# Altium project Servo-Board-v1.0.PrjPcb (part 5 of 23)

## Sheet Sec_Controller_Sheet3.SchDoc
size 420 x 297 mm; SheetNumber: 18; SheetTotal: 26
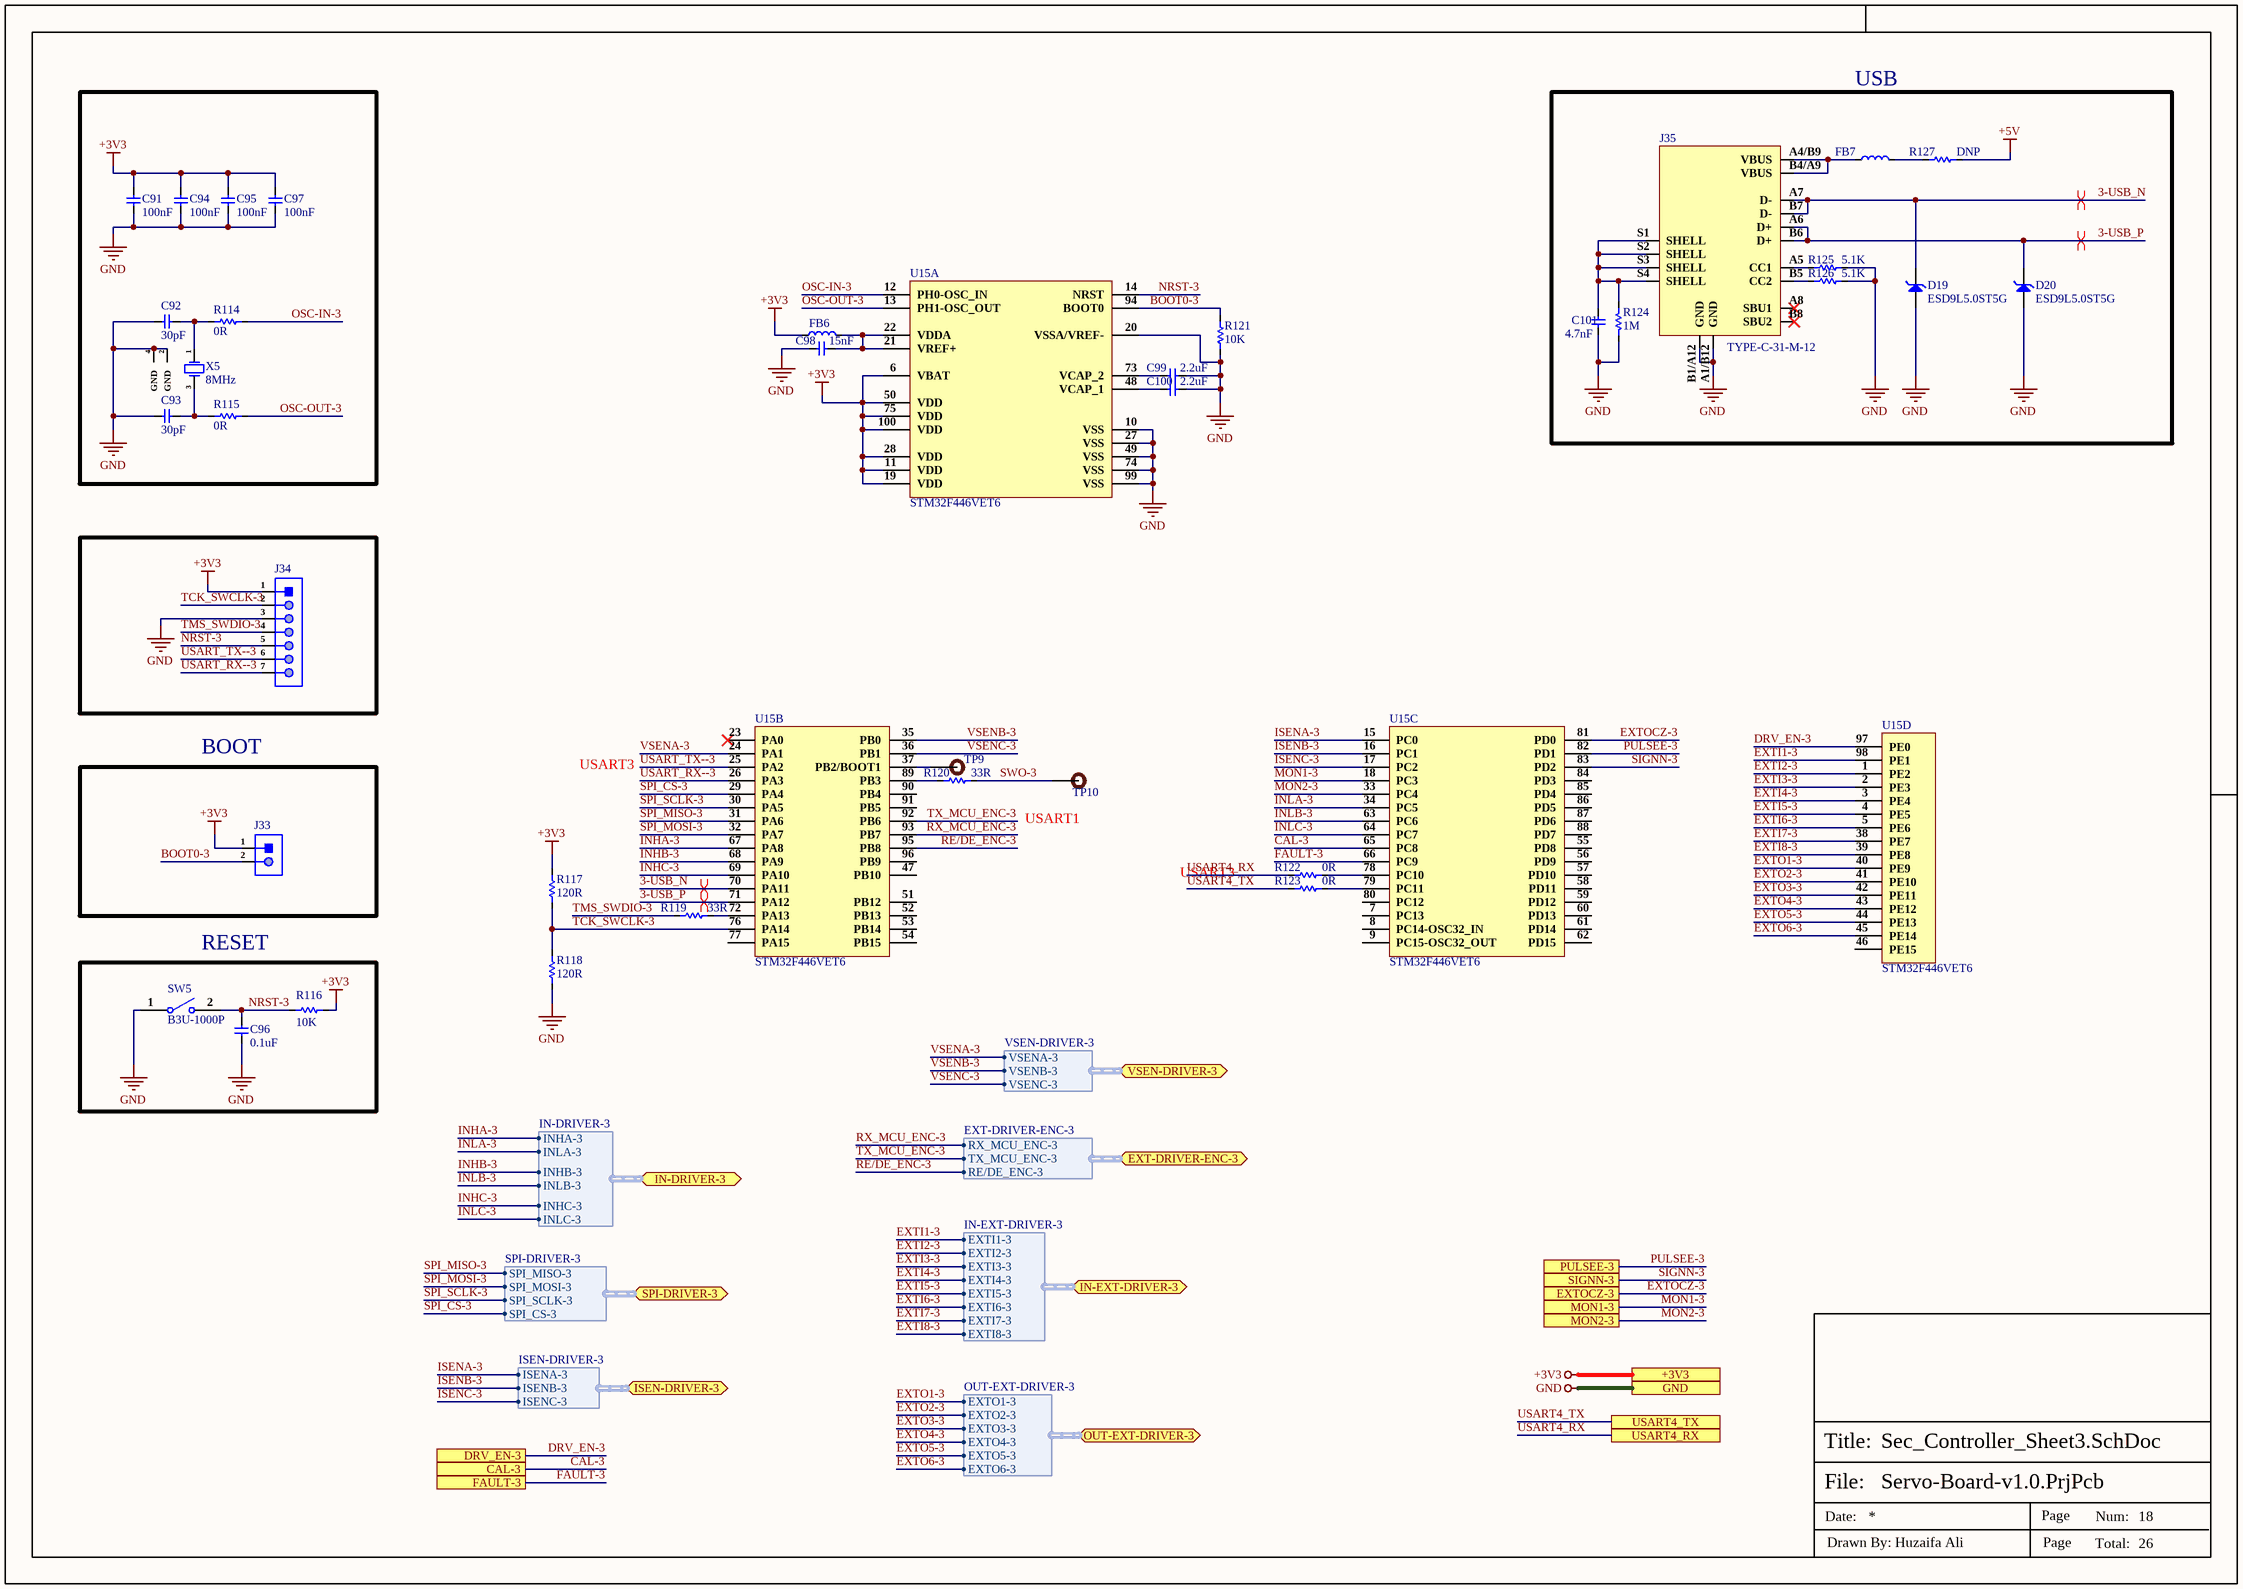
[diagram p6: Sec_Controller_Sheet3.SchDoc]

### Parts
C91  100nF  [cap-0402]
C92  30pF  [Cap-0402]
C93  30pF  [Cap-0402]
C94  100nF  [cap-0402]
C95  100nF  [cap-0402]
C96  0.1uF  [Cap-0402]
C97  100nF  [cap-0402]
C98  15nF  [Cap-0402]
C99  2.2uF  [Cap-0402]
C100  2.2uF  [Cap-0402]
C101  4.7nF  [Cap-0603]
D19  ESD9L5.0ST5G  [SOD-923.]
D20  ESD9L5.0ST5G  [SOD-923.]
FB6  BLM18PG221SN1D  [IND-0603 (1608 Metric)]  (value not drawn)
FB7  BLM18PG221SN1D  [IND-0603 (1608 Metric)]  (value not drawn)
J33  X6511WV-02H-C60D30  [HDR1X2_]  (value not drawn)
J34  X6511WV-07H-C60D30  [HDR1X7]  (value not drawn)
J35  TYPE-C-31-M-12  [TYPE-C-31-M-12_]
R114  0R  [Res-0603]
R115  0R  [Res-0603]
R116  10K  [Res-0402]
R117  120R  [Res-0402]
R118  120R  [Res-0402]
R119  33R  [Res-0402]
R120  33R  [Res-0402]
R121  10K  [Res-0402]
R122  0R  [Res-0402]
R123  0R  [Res-0402]
R124  1M  [Res-0402]
R125  5.1K  [Res-0402]
R126  5.1K  [Res-0402]
R127  DNP  [Res-0402]
SW5  B3U-1000P  [B3U-1000P]
TP9  TEST POINT 0.5mm Dia  [Test-point - 0.5mm]  (value not drawn)  (no BOM)
TP10  TEST POINT 0.5mm Dia  [Test-point - 0.5mm]  (value not drawn)  (no BOM)
U15  STM32F446VET6  [LQFP-100]  (parts A,B,C,D of 4)
X5  8MHz  [5TJ480000XYLBC_]

### Blocks framed on the sheet
USB: C101 D19 D20 FB7 J35 R124-R127
BOOT: J33
RESET: C96 R116 SW5

### Ports
+3V3 (see Servo3[3A], CAN_Sheet[4D], Controller_Sheet[5D], DIO_1[5D], DIO_2[5D], DIO_3[5D], DIO_4[5D], Encoder_Sheet1[5D], Encoder_Sheet2[4D], Encoder_Sheet3[4D], Encoder_Sheet4[5D], EtherCAT_Sheet[5D], Motor_Driver_Sheet1[5D], Motor_Driver_Sheet2[5D], Motor_Driver_Sheet3[5D], Motor_Driver_Sheet4[5D], Power_Sheet[5D], RS485_RS232_Sheet[5D], Sec_Controller_Sheet1[5D], Sec_Controller_Sheet2[5D], Sec_Controller_Sheet4[5D], Servo1[5D], Servo2[5D], Servo3[5D], Servo4[5D]), CAL-3 (see Servo3[3B], Motor_Driver_Sheet3[1D]), DRV_EN-3 (see Servo3[3B], Motor_Driver_Sheet3[1D]), EXT-DRIVER-ENC-3 (bidir, harness EXT-DRIVER-ENC-3, see Servo3[4B], Encoder_Sheet3[3D]), EXTOCZ-3 (see Servo3[4B], DIO_3[3D]), FAULT-3 (see Servo3[3B], Motor_Driver_Sheet3[1D]), GND (see Servo3[3A], CAN_Sheet[4D], Controller_Sheet[5D], DIO_1[5D], DIO_2[5D], DIO_3[5D], DIO_4[5D], Encoder_Sheet1[5D], Encoder_Sheet2[4D], Encoder_Sheet3[4D], Encoder_Sheet4[5D], EtherCAT_Sheet[5D], Motor_Driver_Sheet1[5D], Motor_Driver_Sheet2[5D], Motor_Driver_Sheet3[5D], Motor_Driver_Sheet4[5D], Power_Sheet[5D], RS485_RS232_Sheet[5D], Sec_Controller_Sheet1[5D], Sec_Controller_Sheet2[5D], Sec_Controller_Sheet4[5D], Servo1[5D], Servo2[5D], Servo3[5D], Servo4[5D]), IN-DRIVER-3 (bidir, harness IN-DRIVER-3, see Servo3[3B], Motor_Driver_Sheet3[1D]), IN-EXT-DRIVER-3 (bidir, harness IN-EXT-DRIVER-3, see Servo3[4B], DIO_3[1D]), ISEN-DRIVER-3 (bidir, harness ISEN-DRIVER-3, see Servo3[3B], Motor_Driver_Sheet3[3D]), MON1-3 (see Servo3[4B], DIO_3[3D]), MON2-3 (see Servo3[4B], DIO_3[3D]), OUT-EXT-DRIVER-3 (bidir, harness OUT-EXT-DRIVER-3, see Servo3[4B], DIO_3[2D]), PULSEE-3 (see Servo3[4B], DIO_3[3D]), SIGNN-3 (see Servo3[4B], DIO_3[3D]), SPI-DRIVER-3 (bidir, harness SPI-DRIVER-3, see Servo3[3B], Motor_Driver_Sheet3[2D]), USART4_RX (see Servo3[3B], Controller_Sheet[4D], Servo3[3B]), USART4_TX (see Servo3[3B], Controller_Sheet[4D], Servo3[3B]), VSEN-DRIVER-3 (bidir, harness VSEN-DRIVER-3, see Servo3[3B], Motor_Driver_Sheet3[4D])

### Harnesses
IN-DRIVER-3: INHA-3, INLA-3, INHB-3, INLB-3, INHC-3, INLC-3
SPI-DRIVER-3: SPI_MISO-3, SPI_MOSI-3, SPI_SCLK-3, SPI_CS-3
ISEN-DRIVER-3: ISENA-3, ISENB-3, ISENC-3
EXT-DRIVER-ENC-3: RX_MCU_ENC-3, TX_MCU_ENC-3, RE/DE_ENC-3
IN-EXT-DRIVER-3: EXTI1-3, EXTI2-3, EXTI3-3, EXTI4-3, EXTI5-3, EXTI6-3, EXTI7-3, EXTI8-3
OUT-EXT-DRIVER-3: EXTO1-3, EXTO2-3, EXTO3-3, EXTO4-3, EXTO5-3, EXTO6-3
VSEN-DRIVER-3: VSENA-3, VSENB-3, VSENC-3

### Nets
+3V3: C91.2 C94.2 C95.2 C97.2 FB6.1 J33.1 J34.1 R116.2 R117.2 U15.6(VBAT) U15.11(VDD) U15.19(VDD) U15.28(VDD) U15.50(VDD) U15.75(VDD) U15.100(VDD) ; port +3V3
+5V: R127.2
GND: C91.1 C92.1 C93.1 C94.1 C95.1 C96.1 C97.1 C98.1 C99.2 C100.2 C101.1 D19.2(A) D20.2(A) J34.3 J35.A1/B12(GND) J35.B1/A12(GND) R118.1 R121.1 R124.2 R125.2 R126.2 SW5.1 U15.10(VSS) U15.20(VSSA/VREF-) U15.27(VSS) U15.49(VSS) U15.74(VSS) U15.99(VSS) X5.2(GND) X5.4(GND) ; port GND
3-USB_N: D19.1(K) J35.A7(D-) J35.B7(D-) U15.70(PA11)
3-USB_P: D20.1(K) J35.A6(D+) J35.B6(D+) U15.71(PA12)
BOOT0-3: J33.2 R121.2 U15.94(BOOT0)
CAL-3: U15.65(PC8) ; port CAL-3
DRV_EN-3: U15.97(PE0) ; port DRV_EN-3
EXTI1-3: U15.98(PE1) ; port IN-EXT-DRIVER-3.EXTI1-3
EXTI2-3: U15.1(PE2) ; port IN-EXT-DRIVER-3.EXTI2-3
EXTI3-3: U15.2(PE3) ; port IN-EXT-DRIVER-3.EXTI3-3
EXTI4-3: U15.3(PE4) ; port IN-EXT-DRIVER-3.EXTI4-3
EXTI5-3: U15.4(PE5) ; port IN-EXT-DRIVER-3.EXTI5-3
EXTI6-3: U15.5(PE6) ; port IN-EXT-DRIVER-3.EXTI6-3
EXTI7-3: U15.38(PE7) ; port IN-EXT-DRIVER-3.EXTI7-3
EXTI8-3: U15.39(PE8) ; port IN-EXT-DRIVER-3.EXTI8-3
EXTO1-3: U15.40(PE9) ; port OUT-EXT-DRIVER-3.EXTO1-3
EXTO2-3: U15.41(PE10) ; port OUT-EXT-DRIVER-3.EXTO2-3
EXTO3-3: U15.42(PE11) ; port OUT-EXT-DRIVER-3.EXTO3-3
EXTO4-3: U15.43(PE12) ; port OUT-EXT-DRIVER-3.EXTO4-3
EXTO5-3: U15.44(PE13) ; port OUT-EXT-DRIVER-3.EXTO5-3
EXTO6-3: U15.45(PE14) ; port OUT-EXT-DRIVER-3.EXTO6-3
EXTOCZ-3: U15.81(PD0) ; port EXTOCZ-3
FAULT-3: U15.66(PC9) ; port FAULT-3
INHA-3: U15.67(PA8) ; port IN-DRIVER-3.INHA-3
INHB-3: U15.68(PA9) ; port IN-DRIVER-3.INHB-3
INHC-3: U15.69(PA10) ; port IN-DRIVER-3.INHC-3
INLA-3: U15.34(PC5) ; port IN-DRIVER-3.INLA-3
INLB-3: U15.63(PC6) ; port IN-DRIVER-3.INLB-3
INLC-3: U15.64(PC7) ; port IN-DRIVER-3.INLC-3
ISENA-3: U15.15(PC0) ; port ISEN-DRIVER-3.ISENA-3
ISENB-3: U15.16(PC1) ; port ISEN-DRIVER-3.ISENB-3
ISENC-3: U15.17(PC2) ; port ISEN-DRIVER-3.ISENC-3
MON1-3: U15.18(PC3) ; port MON1-3
MON2-3: U15.33(PC4) ; port MON2-3
NRST-3: C96.2 J34.5 R116.1 SW5.2 U15.14(NRST)
OSC-IN-3: R114.2 U15.12(PH0-OSC_IN)
OSC-OUT-3: R115.2 U15.13(PH1-OSC_OUT)
PULSEE-3: U15.82(PD1) ; port PULSEE-3
RE/DE_ENC-3: U15.95(PB8) ; port EXT-DRIVER-ENC-3.RE/DE_ENC-3
RX_MCU_ENC-3: U15.93(PB7) ; port EXT-DRIVER-ENC-3.RX_MCU_ENC-3
SIGNN-3: U15.83(PD2) ; port SIGNN-3
SPI_CS-3: U15.29(PA4) ; port SPI-DRIVER-3.SPI_CS-3
SPI_MISO-3: U15.31(PA6) ; port SPI-DRIVER-3.SPI_MISO-3
SPI_MOSI-3: U15.32(PA7) ; port SPI-DRIVER-3.SPI_MOSI-3
SPI_SCLK-3: U15.30(PA5) ; port SPI-DRIVER-3.SPI_SCLK-3
SWO-3: R120.2 TP10.1
TCK_SWCLK-3: J34.2 R117.1 R118.2 U15.76(PA14)
TMS_SWDIO-3: J34.4 R119.1
TX_MCU_ENC-3: U15.92(PB6) ; port EXT-DRIVER-ENC-3.TX_MCU_ENC-3
USART4_RX: R122.1 ; port USART4_RX
USART4_TX: R123.1 ; port USART4_TX
USART_RX--3: J34.7 U15.26(PA3)
USART_TX--3: J34.6 U15.25(PA2)
VSENA-3: U15.24(PA1) ; port VSEN-DRIVER-3.VSENA-3
VSENB-3: U15.35(PB0) ; port VSEN-DRIVER-3.VSENB-3
VSENC-3: U15.36(PB1) ; port VSEN-DRIVER-3.VSENC-3
NetC92_2: C92.2 R114.1 X5.1(OSC1)
NetC93_2: C93.2 R115.1 X5.3(OSC2)
NetC98_2: C98.2 FB6.2 U15.21(VREF+) U15.22(VDDA)
NetC99_1: C99.1 U15.73(VCAP_2)
NetC100_1: C100.1 U15.48(VCAP_1)
NetC101_2: C101.2 J35.S1(SHELL) J35.S2(SHELL) J35.S3(SHELL) J35.S4(SHELL) R124.1
NetFB7_1: FB7.1 J35.A4/B9(VBUS) J35.B4/A9(VBUS)
NetFB7_2: FB7.2 R127.1
NetJ35_A5: J35.A5(CC1) R125.1
NetJ35_B5: J35.B5(CC2) R126.1
NetR119_2: R119.2 U15.72(PA13)
NetR120_1: R120.1 U15.89(PB3)
NetR122_2: R122.2 U15.78(PC10)
NetR123_2: R123.2 U15.79(PC11)
NetTP9_1: TP9.1 U15.37(PB2/BOOT1)

Not connected (* = marked no-connect by the designer): J35 A8(SBU1)* B8(SBU2)*; U15 7(PC13) 8(PC14-OSC32_IN) 9(PC15-OSC32_OUT) 23(PA0)* 46(PE15) 47(PB10) 51(PB12) 52(PB13) 53(PB14) 54(PB15) 55(PD8) 56(PD9) 57(PD10) 58(PD11) 59(PD12) 60(PD13) 61(PD14) 62(PD15) 77(PA15) 80(PC12) 84(PD3) 85(PD4) 86(PD5) 87(PD6) 88(PD7) 90(PB4) 91(PB5) 96(PB9)

### Layout directives
differential pair; net class USB_PROGRAM; differential pair class USB_PROGRAM_LINES; rule Impedance Constraint [Min = 85.00    Max = 90.00    ]; rule Matched Net Lengths [Tolerance = 50mil]: 3-USB_N, 3-USB_P

### Notes on the sheet
- USART3
- (near TP10) USART1
- File:
- Title:
- Date:
- Page
- Num:
- Total:
- Drawn By: Huzaifa Ali

### Library data of the parts
C91 C94 C95 C97 = C1005X7R1H104KT000F: CAP CER 0.1UF 50V X7R 0402; Manufacturer: TDK; Tolerance: 10%; Voltage: 25V; Item Type: Capacitor; Supplier 1: Avnet; Manufacturer Part Number: C1005X7R1H104KT000F; RoHS: No; Category: Ceramic Capacitors; Dielectric: X7R; Supplier Part Number 1: C1005X7R1H104KT000F; LCSC Part Number: C361198; ComponentLink1Description: LCSC; ComponentLink1URL: https://www.lcsc.com/product-detail/Multilayer-Ceramic-Capacitors-MLCC-SMD-SMT_TDK-C1005X7R1H104KT000F_C361198.html
C92 C93 = CC0402GRNPO9BN300: CAP CER 30PF 50V C0G/NPO 0402; Manufacturer: Yageo; Item Type: Capacitor; Tolerance: 2%; Dielectric: C0G; Supplier: Digikey; LCSC Part Number: C277479; Manufacturer Part Number: CC0402GRNPO9BN300; RoHS: Yes; Stock: 114930; Pricing: 1=0.1, 10=0.052, 50=0.0296, 100=0.023, 500=0.01728, 1000=0.01358, 2500=0.01235, 5000=0.01136 (USD); Mounting Technology: Surface Mount; Case/Package: 0402; Case Code (Imperial): 0402; Case Code (Metric): 1005; Weight: 2.3E-05oz; Min Operating Temperature: -55°C; Max Operating Temperature: 125°C; Value: 30pF; Voltage Rating (DC): 50V; Packaging: Tape and Reel; Termination: SMD/SMT; Voltage Rating: 50V; Series: CC; Length: 0.039inch; Width: 0.02inch; Thickness: 0.022inch; Halogen Free: 5694HalogenFree; Lead Free: 5697LeadFree; ComponentLink1URL: https://datasheet.ciiva.com/13263/upy-gp-np0-16v-to-50v-8-3714-13263350.pdf?src-supplier=Mouser; ComponentLink1Description: https://datasheet.ciiva.com/13263/upy-gp-np0-16v-to-50v-8-3714-13263350.pdf?src-supplier=Mouser
C96 = CC0402JRX7R7BB104: CAP CER 0.1UF 16V X7R 0402; Manufacturer: Yageo; Material: 4241ConductorMaterial; Value: 100nF; Tolerance: 5%; Item Type: Capacitor; Supplier: Digikey; Supplier Part Number: 311-1676-1-ND; Manufacturer Part Number: CC0402JRX7R7BB104; RoHS: Yes; Category: Ceramic Capacitors; Stock: 1659111; Pricing: 1=0.1, 10=0.046, 50=0.0262, 100=0.0203, 500=0.01528, 1000=0.012, 2500=0.01091, 5000=0.01004 (USD); Mounting Technology: Surface Mount; Case/Package: 0402; Case Code (Metric): 1005; Case Code (Imperial): 0402; Min Operating Temperature: -55°C; Max Operating Temperature: 125°C; Dielectric: X7R; Packaging: Tape and Reel; Package Quantity: 10000; Voltage Rating (DC): 16V; Voltage Rating: 16V; Series: CC; Construction: Flat; Length: 0.039inch; Width: 0.02inch; Height: 0.5mm; Thickness: 0.022inch; Lead Free: Lead Free; Halogen Free: Halogen Free; RoHS Compliant: Yes; ComponentLink1URL: https://datasheet.ciiva.com/13210/upy-gphc-x7r-6-3v-to-50v-8-12304-13210152.pdf?src-supplier=Mouser; ComponentLink1Description: https://datasheet.ciiva.com/13210/upy-gphc-x7r-6-3v-to-50v-8-12304-13210152.pdf?src-supplier=Mouser; LCSC Part Number: C541464
C98 = CC0402JRX7R7BB153: CAP CER 0.015UF 16V X7R 0402; Manufacturer: Yageo; Tolerance: 5%; Item Type: Capacitor; Supplier: Digikey; Supplier Part Number: 13-CC0402JRX7R7BB153CT-ND; Manufacturer Part Number: CC0402JRX7R7BB153; RoHS: Yes; Category: Ceramic Capacitors; Stock: 24539; Pricing: 1=0.1, 10=0.045, 50=0.0258, 100=0.0201, 500=0.0151, 1000=0.01186, 2500=0.01078, 5000=0.00992 (USD); Mounting Technology: Surface Mount; Case/Package: 0402; Case Code (Imperial): 0402; Case Code (Metric): 1005; Weight: 2.3E-05oz; Min Operating Temperature: -55°C; Max Operating Temperature: 125°C; Value: 15nF; Voltage Rating (DC): 16V; Packaging: Tape and Reel; Dielectric: X7R; Voltage Rating: 16V; Termination: SMD/SMT; Series: CC; Length: 0.039inch; Width: 0.02inch; Thickness: 0.022inch; Lead Free: Lead Free; Halogen Free: Halogen Free; RoHS Compliant: Yes; ComponentLink1URL: https://datasheet.ciiva.com/13263/upy-gphc-x7r-6-3v-to-50v-8-12304-13263342.pdf?src-supplier=Mouser; ComponentLink1Description: https://datasheet.ciiva.com/13263/upy-gphc-x7r-6-3v-to-50v-8-12304-13263342.pdf?src-supplier=Mouser; LCSC Part Number: C527002
C99 C100 = C1005X5R0J225KTJA0E: CAP CER 2.2UF 6.3V X5R 0402; Manufacturer: TDK; Item Type: Capacitor; LCSC Part Number: C343036; Manufacturer Part Number: C1005X5R0J225KTJA0E; ComponentLink1Description: LCSC; ComponentLink1URL: https://www.lcsc.com/product-detail/Multilayer-Ceramic-Capacitors-MLCC-SMD-SMT_TDK-C1005X5R0J225KTJA0E_C343036.html
C101 = CC0603JRNPO9BN472: CAP CER 4700PF 50V C0G/NPO 0603; Manufacturer: Yageo; Item Type: Capacitor; Supplier 1: Digi-Key; Manufacturer Part Number: CC0603JRNPO9BN472; RoHS: Yes; Category: Ceramic Capacitors; Stock 1: 31779; Pricing 1: 1=0.48000, 10=0.33000, 50=0.23100, 100=0.19800, 500=0.14854, 1000=0.12543 (USD); RoHS Compliant: Yes; Supplier Part Number 1: 13-CC0603JRNPO9BN472CT-ND; LCSC Part Number: C576818; ComponentLink1Description: LCSC; ComponentLink1URL: https://www.lcsc.com/product-detail/Multilayer-Ceramic-Capacitors-MLCC-SMD-SMT_YAGEO-CC0603JRNPO9BN472_C576818.html
D19 D20 = ESD9L5.0ST5G: TVS DIODE 5V 9.8V SOD923; Manufacturer: ON Semiconductor; Capacitance: 0.9pF; Direction: Unidirectional; Number of Unidirectional Channels: 1; Min Breakdown Voltage: 5.4V; Power Line Protection: No; Leakage Current: 1uA; Element Configuration: Single; Peak Pulse Current: 1A; Diode Type: ZENER; Reverse Breakdown Voltage: 5.8V; Peak Pulse Power: 150mW; ESD Protection: Yes; Test Current: 1mA; Supplier 1: Digi-Key; Manufacturer Part Number: ESD9L5.0ST5G; RoHS: Yes; Category: ESD and Circuit Protection ICs; Stock 1: 558996; Pricing 1: 1=0.37000, 10=0.25600, 100=0.12500, 500=0.10426, 1000=0.07244, 2000=0.06278 (USD); Case/Package: SOD-923-2; Number of Pins: 2; Contact Plating: Tin,Matte; Min Operating Temperature: -55°C; Max Operating Temperature: 150°C; Package Quantity: 1; Packaging: Tape and Reel; Clamping Voltage: 9.8V; Reverse Standoff Voltage: 5V; Working Voltage: 5V; Resistor Type: Zener; Series: Automotive, AEC-Q101; Number of Elements: 1; Operating Supply Voltage: 5V; Max Surge Current: 1A; Breakdown Voltage: 5.4V; Number of Channels: 1; Polarity: Unidirectional; Termination: SMD/SMT; Max Reverse Leakage Current: 1uA; Max Breakdown Voltage: 5.4V; Number of Lines: 1; Power Dissipation: 150mW; Clamping Voltage-Max: 9.8V; Length: 0.8mm; Width: 0.65mm; Height: 0.4mm; Depth: 0.6mm; Radiation Hardening: No; Lead Free: Lead Free; RoHS Compliant: Yes; REACH SVHC: No SVHC; Halogen Free: Halogen Free; ComponentLink1URL: https://datasheet.ciiva.com/15143/getdatasheetpartid-185186-15143896.pdf?src-supplier=Verical; ComponentLink1Description: https://datasheet.ciiva.com/15143/getdatasheetpartid-185186-15143896.pdf?src-supplier=Verical; ComponentLink2URL: https://datasheet.ciiva.com/4510/esd9l-d-4510647.pdf?src-supplier=Mouser; ComponentLink2Description: https://datasheet.ciiva.com/4510/esd9l-d-4510647.pdf?src-supplier=Mouser; ComponentLink3URL: https://datasheet.ciiva.com/3304/esd9l-d-3304011.pdf?src-supplier=Avnet; ComponentLink3Description: https://datasheet.ciiva.com/3304/esd9l-d-3304011.pdf?src-supplier=Avnet; ComponentLink4URL: https://datasheet.ciiva.com/16437/esd9l-d-16437835.pdf?src-supplier=Future+Electronics; ComponentLink4Description: https://datasheet.ciiva.com/16437/esd9l-d-16437835.pdf?src-supplier=Future+Electronics; ComponentLink5URL: https://datasheet.ciiva.com/339/esd9l-d-339853.pdf?src-supplier=Digi-Key; ComponentLink5Description: https://datasheet.ciiva.com/339/esd9l-d-339853.pdf?src-supplier=Digi-Key; ComponentLink6URL: https://datasheet.ciiva.com/339/esd9l-d-339854.pdf?src-supplier=Digi-Key; ComponentLink6Description: https://datasheet.ciiva.com/339/esd9l-d-339854.pdf?src-supplier=Digi-Key; ComponentLink7URL: https://datasheet.ciiva.com/11195/esd9l-d-11195342.pdf?src-supplier=Avnet; ComponentLink7Description: https://datasheet.ciiva.com/11195/esd9l-d-11195342.pdf?src-supplier=Avnet; ComponentLink8URL: https://datasheet.ciiva.com/25958/esd9l-d-25958446.pdf?src-supplier=Avnet+Europe; ComponentLink8Description: https://datasheet.ciiva.com/25958/esd9l-d-25958446.pdf?src-supplier=Avnet+Europe; ComponentLink9URL: https://datasheet.ciiva.com/339/esd9l-d-339855.pdf?src-supplier=Digi-Key; ComponentLink9Description: https://datasheet.ciiva.com/339/esd9l-d-339855.pdf?src-supplier=Digi-Key; Supplier Part Number 1: ESD9L5.0ST5GOSCT-ND; LCSC Part Number: C82326
FB6 FB7 = BLM18PG221SN1D: FERRITE BEAD 220 OHM 0603 1LN; Manufacturer: Murata; Manufacturer Series: BLM18P; Material: Steel,Ferrite; Value: 100mR; Impedance: 220R; Tolerance: 25%; Current Rating: 1.4A; Number of Lines: 1; Test Frequency: 100MHz; Shielding: Unshielded; Supplier: Digikey; LCSC Part Number: C80165; Manufacturer Part Number: BLM18PG221SN1D; RoHS: Yes; Item Type: Ferrite Bead; Stock: 134052; Pricing: 1=0.1, 10=0.078, 25=0.0712, 50=0.064, 100=0.0469, 250=0.03412, 500=0.03128, 1000=0.02701 (USD); Case/Package: 0603; Pins: 2; Core Material: Ferrite; Case Code (Metric): 1608; Case Code (Imperial): 0603; Weight: 7.1E-05oz; Min Operating Temperature: -55°C; Max Operating Temperature: 125°C; Package Quantity: 1; Packaging: Tape and Reel; ESR (Equivalent Series Resistance): 220R; Max Current Rating: 1.4A; DC Resistance (DCR): 100mR; Termination: SMD/SMT; Max DC Current: 1.4A; DC Current: 1.4A; Number of Circuits: 1; Series: BLM18P; Channels: 1; DC Resistance-Max: 100mR; RMS Current (Irms): 1.4A; ESR: 100mR; Length: 1.6mm; Width: 0.8mm; Height: 0.8mm; Depth: 0.8mm; Radiation Hardening: No; Reach SVHC Compliant: No; Lead Free: Lead Free; RoHS Compliant: Yes; ComponentLink1URL: https://datasheet.ciiva.com/19458/1845030-19458417.pdf?src-supplier=Jameco; ComponentLink1Description: https://datasheet.ciiva.com/19458/1845030-19458417.pdf?src-supplier=Jameco; ComponentLink2URL: https://datasheet.ciiva.com/11800/0900766b81275ca5-11800851.pdf?src-supplier=Rs; ComponentLink2Description: https://datasheet.ciiva.com/11800/0900766b81275ca5-11800851.pdf?src-supplier=Rs; ComponentLink3URL: https://datasheet.ciiva.com/29347/442391-da-01-en-chip-drossel-0603-220r-1400ma-1-6x0-8mm-29347986.pdf?src-supplier=Conrad; ComponentLink3Description: https://datasheet.ciiva.com/29347/442391-da-01-en-chip-drossel-0603-220r-1400ma-1-6x0-8mm-29347986.pdf?src-supplier=Conrad; ComponentLink4URL: https://datasheet.ciiva.com/8021/5148-8021482.pdf?src-supplier=Element14; ComponentLink4Description: https://datasheet.ciiva.com/8021/5148-8021482.pdf?src-supplier=Element14; ComponentLink5URL: https://datasheet.ciiva.com/8021/5148-8021479.pdf?src-supplier=Element14; ComponentLink5Description: https://datasheet.ciiva.com/8021/5148-8021479.pdf?src-supplier=Element14; ComponentLink6URL: https://datasheet.ciiva.com/14122/blm-series-eng-tds-14122909.pdf?src-supplier=Distrelec; ComponentLink6Description: https://datasheet.ciiva.com/14122/blm-series-eng-tds-14122909.pdf?src-supplier=Distrelec; ComponentLink7URL: https://datasheet.ciiva.com/1012/l0110s0100blm18p-1012162.pdf?src-supplier=Digikey; ComponentLink7Description: https://datasheet.ciiva.com/1012/l0110s0100blm18p-1012162.pdf?src-supplier=Digikey; ComponentLink8URL: https://datasheet.ciiva.com/1012/l0110s0100blm18p-1012161.pdf?src-supplier=Digikey; ComponentLink8Description: https://datasheet.ciiva.com/1012/l0110s0100blm18p-1012161.pdf?src-supplier=Digikey; ComponentLink9URL: https://datasheet.ciiva.com/1012/l0110s0100blm18p-1012163.pdf?src-supplier=Digikey; ComponentLink9Description: https://datasheet.ciiva.com/1012/l0110s0100blm18p-1012163.pdf?src-supplier=Digikey; ComponentLink10URL: https://datasheet.ciiva.com/3081/l0110s0100blm18p-3081633.pdf?src-supplier=Avnet; ComponentLink10Description: https://datasheet.ciiva.com/3081/l0110s0100blm18p-3081633.pdf?src-supplier=Avnet; ComponentLink11URL: https://datasheet.ciiva.com/16205/l0110s0100blm18p-16205422.pdf?src-supplier=Future+Electronics; ComponentLink11Description: https://datasheet.ciiva.com/16205/l0110s0100blm18p-16205422.pdf?src-supplier=Future+Electronics
J33 = X6511WV-02H-C60D30: Gold 250V 3A Straight Square Pins 2.5mm 2P 260℃ 6mm -40℃~+105℃ 3mm 2.54mm Plugin Black Brass 1x2P Plugin,P=2.54mm Pin Headers ROHS; Manufacturer: XKB; Item Type: Male Header; Manufacturer Part Number: X6511WV-02H-C60D30; Package: Plugin,P=2.54mm; LCSC Part Number: C706874; ComponentLink1Description: LCSC; ComponentLink1URL: https://www.lcsc.com/product-detail/Pin-Headers_XKB-Connectivity-X6511WV-02H-C60D30_C706874.html
J34 = X6511WV-07H-C60D30: Gold 250V 3A Straight Square Pins 2.5mm 7P 260℃ 6mm -40℃~+105℃ 3mm 2.54mm Plugin Black Brass 1x7P Plugin,P=2.54mm Pin Headers ROHS; Manufacturer: XKB; Item Type: Male Header; Manufacturer Part Number: X6511WV-07H-C60D30; Package: Plugin,P=2.54mm; LCSC Part Number: C706879; ComponentLink1Description: LCSC; ComponentLink1URL: https://www.lcsc.com/product-detail/Pin-Headers_XKB-Connectivity-X6511WV-07H-C60D30_C706879.html
J35 = TYPE-C-31-M-12: 5A 1 16P Female Type-C SMD USB Connectors ROHS; Manufacturer: Korean Hroparts Elec; ComponentLink1Description: LCSC; ComponentLink1URL: https://www.lcsc.com/product-detail/USB-Connectors_Korean-Hroparts-Elec-TYPE-C-31-M-12_C165948.html; Manufacturer Part Number: TYPE-C-31-M-12; Footprint: Custom; LCSC Part Number: C165948; Item Type: USB Connector
R114 R115 = RC0603JR-070RL: RES 0 OHM JUMPER 1/10W 0603; Manufacturer: Yageo; Resistance: 0mR; Tolerance: 1%; Power Rating: 100mW; Voltage Rating (DC): 50V; Temperature Coefficient: 200ppm/°C; Resistance Tolerance: 5%; Item Type: Resistor; Supplier 1: Digi-Key; Manufacturer Part Number: RC0603JR-070RL; RoHS: Yes; Category: Chip SMD Resistors; Stock 1: 18081776; Pricing 1: 1=0.10000, 10=0.01700, 25=0.01240, 50=0.00960, 100=0.00700, 250=0.00536, 500=0.00430, 1000=0.00316 (USD); Case/Package: 0603; Number of Pins: 2; Contact Plating: Tin,Matte; Case Code (Imperial): 0603; Case Code (Metric): 1608; Size Code: 0603; Min Operating Temperature: -55°C; Max Operating Temperature: 155°C; Resistor Type: Thick Film; Packaging: Tape and Reel; Termination: SMD/SMT; Series: RC; Technology: THICK FILM; Package Quantity: 5000; Voltage Rating: 50V; Features: Moisture Resistant; Max Power Dissipation: 100mW; Number of Terminations: 2; Construction: Rectangular; Length: 1.6mm; Width: 0.8mm; Height: 0.45mm; Depth: 0.8mm; Radiation Hardening: No; Reach SVHC Compliant: No SVHC; Lead Free: Lead Free; RoHS Compliant: Yes; Military Standard: Not; Supplier Part Number 1: 311-0.0GRCT-ND; LCSC Part Number: C95177
R116 R121 = RC0402FR-0710KL: RES 10K OHM 1% 1/16W 0402; Manufacturer: Yageo; Resistance: 10kR; Voltage Rating (DC): 50V; Temperature Coefficient: 100ppm/°C; Power Rating: 62.5mW; Max Power Dissipation: 63mW; Item Type: Resistor; Supplier 1: Mouser; Manufacturer Part Number: RC0402FR-0710KL; RoHS: Yes; Category: Chip SMD Resistors; Stock 1: 18648329; Pricing 1: 1=0.10000, 10=0.01400, 50=0.01400, 100=0.00500, 1000=0.00300, 10000=0.00200 (USD); Case/Package: 0402; Number of Pins: 2; Case Code (Imperial): 0402; Case Code (Metric): 1005; Min Operating Temperature: -55°C; Max Operating Temperature: 155°C; Resistor Type: Thick Film; Tolerance: 1%; Packaging: Tape and Reel; Voltage Rating: 50V; Termination: SMD/SMT; Working Voltage: 50V; Number of Terminations: 2; Features: Moisture Resistant; Series: RC; Resistance Tolerance: 1%; Construction: Rectangular; Length: 1mm; Width: 0.5mm; Height: 0.32mm; Depth: 0.5mm; Lead Pitch: 0.2mm; REACH SVHC: No SVHC; Lead Free: Lead Free; RoHS Compliant: Yes; Military Standard: Not; ComponentLink1URL: https://datasheet.ciiva.com/7660/38568-7660787.pdf?src-supplier=Element14; ComponentLink1Description: https://datasheet.ciiva.com/7660/38568-7660787.pdf?src-supplier=Element14; ComponentLink2URL: https://datasheet.ciiva.com/7849/1686128-7849814.pdf?src-supplier=Element14; ComponentLink2Description: https://datasheet.ciiva.com/7849/1686128-7849814.pdf?src-supplier=Element14; ComponentLink3URL: https://datasheet.ciiva.com/7983/1018594-7983486.pdf?src-supplier=Element14; ComponentLink3Description: https://datasheet.ciiva.com/7983/1018594-7983486.pdf?src-supplier=Element14; ComponentLink4URL: https://datasheet.ciiva.com/22747/1018594-22747512.pdf?src-supplier=Element14; ComponentLink4Description: https://datasheet.ciiva.com/22747/1018594-22747512.pdf?src-supplier=Element14; ComponentLink5URL: https://datasheet.ciiva.com/12667/pyu-rc0402-51-rohs-l-6-r-12667067.pdf?src-supplier=Mouser; ComponentLink5Description: https://datasheet.ciiva.com/12667/pyu-rc0402-51-rohs-l-6-r-12667067.pdf?src-supplier=Mouser; ComponentLink6URL: https://datasheet.ciiva.com/7849/1784430-7849813.pdf?src-supplier=Element14; ComponentLink6Description: https://datasheet.ciiva.com/7849/1784430-7849813.pdf?src-supplier=Element14; ComponentLink7URL: https://datasheet.ciiva.com/7849/1784430-7849815.pdf?src-supplier=Element14; ComponentLink7Description: https://datasheet.ciiva.com/7849/1784430-7849815.pdf?src-supplier=Element14; Supplier Part Number 1: 603-RC0402FR-0710KL; LCSC Part Number: C60490
R117 R118 = RC0402FR-07120RL: RES 120 OHM 1% 1/16W 0402; Manufacturer: Yageo; Item Type: Resistors; Power Rating: 62.5mW; Voltage Rating: 50V; Temperature Coefficient: 100ppm/°C; Max Power Dissipation: 63mW; Supplier: Future Electronics; Supplier Part Number: 4529079; Manufacturer Part Number: RC0402FR-07120RL; RoHS: Yes; Stock: 150000; Pricing: 10000=0.0012, 100000=0.0011, 300000=0.001, 750000=0.001, 2000000=0.0009 (USD); Case/Package: 0402; Case Code (Imperial): 0402; Case Code (Metric): 1005; Min Operating Temperature: -55°C; Max Operating Temperature: 155°C; Package Quantity: 1; Value: 120R; Tolerance: 1%; Packaging: Tape and Reel; Termination: SMD/SMT; Resistor Type: Thick Film; Number of Terminations: 2; Features: Moisture Resistant; Series: RC; Resistance Tolerance: 1%; Construction: Rectangular; Technology: THICK FILM; Voltage Rating (AC): 50V; Length: 0.039inch; Width: 0.02inch; Height: 0.016inch; Depth: 0.5mm; Reach SVHC Compliant: No; Military Standard: Not; RoHS Compliant: Yes; Lead Free: 5697LeadFree; ComponentLink1URL: https://datasheet.ciiva.com/12667/pyu-rc0402-51-rohs-l-6-r-12667958.pdf?src-supplier=Mouser; ComponentLink1Description: https://datasheet.ciiva.com/12667/pyu-rc0402-51-rohs-l-6-r-12667958.pdf?src-supplier=Mouser; ComponentLink2URL: https://datasheet.ciiva.com/7849/1018594-7849831.pdf?src-supplier=Element14; ComponentLink2Description: https://datasheet.ciiva.com/7849/1018594-7849831.pdf?src-supplier=Element14; LCSC Part Number: C114758
R119 R120 = RC0402FR-0733RL: RES 33 OHM 1% 1/16W 0402; Manufacturer: Yageo; Power Rating: 62.5mW; Voltage Rating: 50V; Temperature Coefficient: 100ppm/°C; Max Power Dissipation: 63mW; Supplier 1: Mouser; Manufacturer Part Number: RC0402FR-0733RL; RoHS: Yes; Category: Chip SMD Resistors; Stock 1: 1843488; Pricing 1: 1=0.10000, 10=0.01200, 50=0.01200, 100=0.00500, 1000=0.00300, 10000=0.00100 (USD); Case/Package: 0402; Number of Pins: 2; Case Code (Imperial): 0402; Case Code (Metric): 1005; Size Code: 0402; Min Operating Temperature: -55°C; Max Operating Temperature: 155°C; Resistor Type: Thick Film; Resistance: 33R; Tolerance: 1%; Packaging: Tape and Reel; Voltage Rating (DC): 50V; Package Quantity: 10000; Termination: SMD/SMT; Features: Moisture Resistant; Series: RC; Number of Terminations: 2; Resistance Tolerance: 1%; Construction: Rectangular; Technology: THICK FILM; Length: 1mm; Width: 0.5mm; Height: 0.35mm; Depth: 0.5mm; RoHS Compliant: Yes; REACH SVHC: Unknown; Military Standard: Not; Lead Free: Lead Free; ComponentLink1URL: https://datasheet.ciiva.com/11819/0900766b80c66297-11819487.pdf?src-supplier=RSComponents; ComponentLink1Description: https://datasheet.ciiva.com/11819/0900766b80c66297-11819487.pdf?src-supplier=RSComponents; ComponentLink2URL: https://datasheet.ciiva.com/24070/pyu-rc0402-51-rohs-l-6-r-8721-24070077.pdf?src-supplier=Mouser; ComponentLink2Description: https://datasheet.ciiva.com/24070/pyu-rc0402-51-rohs-l-6-r-8721-24070077.pdf?src-supplier=Mouser; ComponentLink3URL: https://datasheet.ciiva.com/7849/1018594-7849967.pdf?src-supplier=Element14; ComponentLink3Description: https://datasheet.ciiva.com/7849/1018594-7849967.pdf?src-supplier=Element14; ComponentLink4URL: https://datasheet.ciiva.com/7849/1018594-7849966.pdf?src-supplier=Element14; ComponentLink4Description: https://datasheet.ciiva.com/7849/1018594-7849966.pdf?src-supplier=Element14; ComponentLink5URL: https://datasheet.ciiva.com/15189/getdatasheetpartid-329253-15189431.pdf?src-supplier=Verical; ComponentLink5Description: https://datasheet.ciiva.com/15189/getdatasheetpartid-329253-15189431.pdf?src-supplier=Verical; ComponentLink6URL: https://datasheet.ciiva.com/17070/pyu-rc0402-51-rohs-l-6-r-17070335.pdf?src-supplier=Future+Electronics; ComponentLink6Description: https://datasheet.ciiva.com/17070/pyu-rc0402-51-rohs-l-6-r-17070335.pdf?src-supplier=Future+Electronics; Supplier Part Number 1: 603-RC0402FR-0733RL; LCSC Part Number: C138002
R122 R123 = RC0402FR-070RL: RES 0 OHM JUMPER 1/16W 0402; Manufacturer: Yageo; Item Type: Resistors; Tolerance: 1%; Power Rating: 62.5mW; Voltage Rating: 50V; Temperature Coefficient: 200ppm/°C; Max Power Dissipation: 63mW; Supplier 1: Mouser; Manufacturer Part Number: RC0402FR-070RL; RoHS: Yes; Stock 1: 8556842; Pricing 1: 1=0.10000, 10=0.01400, 50=0.01400, 100=0.00600, 1000=0.00300, 5000=0.00200, 10000=0.00100 (USD); Mount: Surface Mount; Case/Package: 0402; Contact Plating: Tin,Matte; Case Code (Imperial): 0402; Case Code (Metric): 1005; Size Code: 0402; Min Operating Temperature: -55°C; Max Operating Temperature: 155°C; Resistance: 0R; Resistor Type: Thick Film; Packaging: Tape and Reel; Termination: SMD/SMT; Features: Moisture Resistant; Series: RC; Number of Terminations: 2; Length: 1mm; Width: 0.5mm; Height: 0.35mm; Radiation Hardening: No; Lead Free: Lead Free; RoHS Compliant: Yes; ComponentLink1URL: https://datasheet.ciiva.com/8896/pyu-rc0402-51-rohs-l-6-8896149.pdf?src-supplier=Avnet; ComponentLink1Description: https://datasheet.ciiva.com/8896/pyu-rc0402-51-rohs-l-6-8896149.pdf?src-supplier=Avnet; ComponentLink2URL: https://datasheet.ciiva.com/16790/pyu-rc0402-51-rohs-l-6-r-16790444.pdf?src-supplier=Future+Electronics; ComponentLink2Description: https://datasheet.ciiva.com/16790/pyu-rc0402-51-rohs-l-6-r-16790444.pdf?src-supplier=Future+Electronics; Supplier Part Number 1: 603-RC0402FR-070RL; LCSC Part Number: C106231
R124 = AF0402JR-071ML: RES SMD 1M OHM 5% 1/16W 0402; Manufacturer: Yageo; Resistance: 1MR; Max Power Dissipation: 63mW; Temperature Coefficient: 100ppm/°C; Item Type: Resistor; Supplier 1: Digi-Key; Manufacturer Part Number: AF0402JR-071ML; Stock 1: 0; Pricing 1: 10000=0.00408 (USD); Case/Package: 0402; Min Operating Temperature: -55°C; Max Operating Temperature: 155°C; Packaging: Tape and Reel; Resistor Type: Thick Film; Number of Terminations: 2; Tolerance: 5%; Features: Moisture Resistant,Anti-Sulfur; Length: 0.039inch; Width: 0.02inch; Height: 0.015inch; RoHS Compliant: Yes; ComponentLink1URL: https://www.yageo.com/upload/media/product/productsearch/datasheet/rchip/PYu-AF_51_RoHS_L_6.pdf?src-supplier=Digi-Key; ComponentLink1Description: https://www.yageo.com/upload/media/product/productsearch/datasheet/rchip/PYu-AF_51_RoHS_L_6.pdf?src-supplier=Digi-Key; Supplier Part Number 1: AF0402JR-071ML-ND; LCSC Part Number: C144054
R125 R126 = RC0402FR-075K1L: RES 5.1K OHM 1% 1/16W 0402; Manufacturer: Yageo; Power Rating: 63mW; Resistance: 5.1kR; Temperature Coefficient: 100ppm/°C; Voltage Rating: 50V; Item Type: Resistor; Supplier 1: Avnet; Manufacturer Part Number: RC0402FR-075K1L; RoHS: Yes; Category: Chip SMD Resistors; Stock 1: 65000; Pricing 1: 10000=0.00085 (USD); Case/Package: 0402; Case Code (Metric): 1005; Case Code (Imperial): 0402; Min Operating Temperature: -55°C; Max Operating Temperature: 155°C; Tolerance: 1%; Technology: THICK FILM; Packaging: Tape and Reel; Package Quantity: 1; Resistor Type: Thick Film; Number of Terminations: 2; Termination: SMD/SMT; Max Power Dissipation: 63mW; Voltage Rating (DC): 50V; Working Voltage: 50V; Features: Moisture Resistant; Series: RC; Resistance Tolerance: 1%; Construction: Rectangular; Length: 1mm; Width: 0.02inch; Height: 0.016inch; Depth: 0.5mm; RoHS Compliant: Yes; Military Standard: Not; Lead Free: Lead Free; ComponentLink1URL: https://datasheet.ciiva.com/7983/1018594-7983519.pdf?src-supplier=Element14; ComponentLink1Description: https://datasheet.ciiva.com/7983/1018594-7983519.pdf?src-supplier=Element14; ComponentLink2URL: https://datasheet.ciiva.com/46394/1018594-46394936.pdf?src-supplier=Element14; ComponentLink2Description: https://datasheet.ciiva.com/46394/1018594-46394936.pdf?src-supplier=Element14; ComponentLink3URL: https://datasheet.ciiva.com/2453/pyu-r-int-thick-7-2453401.pdf?src-supplier=Digi-Key; ComponentLink3Description: https://datasheet.ciiva.com/2453/pyu-r-int-thick-7-2453401.pdf?src-supplier=Digi-Key; ComponentLink4URL: https://datasheet.ciiva.com/2453/pyu-r-int-thick-7-2453402.pdf?src-supplier=Digi-Key; ComponentLink4Description: https://datasheet.ciiva.com/2453/pyu-r-int-thick-7-2453402.pdf?src-supplier=Digi-Key; ComponentLink5URL: https://datasheet.ciiva.com/2453/pyu-r-int-thick-7-2453400.pdf?src-supplier=Digi-Key; ComponentLink5Description: https://datasheet.ciiva.com/2453/pyu-r-int-thick-7-2453400.pdf?src-supplier=Digi-Key; ComponentLink6URL: https://datasheet.ciiva.com/12558/pyu-rc0402-51-rohs-l-6-r-8721-12558460.pdf?src-supplier=Mouser; ComponentLink6Description: https://datasheet.ciiva.com/12558/pyu-rc0402-51-rohs-l-6-r-8721-12558460.pdf?src-supplier=Mouser; ComponentLink7URL: https://datasheet.ciiva.com/16744/pyu-rc0402-51-rohs-l-6-r-16744283.pdf?src-supplier=Future+Electronics; ComponentLink7Description: https://datasheet.ciiva.com/16744/pyu-rc0402-51-rohs-l-6-r-16744283.pdf?src-supplier=Future+Electronics; ComponentLink8URL: https://datasheet.ciiva.com/15189/getdatasheetpartid-323636-15189493.pdf?src-supplier=Verical; ComponentLink8Description: https://datasheet.ciiva.com/15189/getdatasheetpartid-323636-15189493.pdf?src-supplier=Verical; Supplier Part Number 1: RC0402FR-075K1L; LCSC Part Number: C105872
R127 = RC0402FR-070RL: RES 0 OHM JUMPER 1/16W 0402; Manufacturer: Yageo; Item Type: Resistors; Resistance: 0R; Tolerance: 1%; Power Rating: 62.5mW; Voltage Rating: 50V; Temperature Coefficient: 200ppm/°C; Max Power Dissipation: 63mW; Supplier 1: Mouser; Manufacturer Part Number: RC0402FR-070RL; RoHS: Yes; Stock 1: 8556842; Pricing 1: 1=0.10000, 10=0.01400, 50=0.01400, 100=0.00600, 1000=0.00300, 5000=0.00200, 10000=0.00100 (USD); Mount: Surface Mount; Case/Package: 0402; Contact Plating: Tin,Matte; Case Code (Imperial): 0402; Case Code (Metric): 1005; Size Code: 0402; Min Operating Temperature: -55°C; Max Operating Temperature: 155°C; Resistor Type: Thick Film; Packaging: Tape and Reel; Termination: SMD/SMT; Features: Moisture Resistant; Series: RC; Number of Terminations: 2; Length: 1mm; Width: 0.5mm; Height: 0.35mm; Radiation Hardening: No; Lead Free: Lead Free; RoHS Compliant: Yes; ComponentLink1URL: https://datasheet.ciiva.com/8896/pyu-rc0402-51-rohs-l-6-8896149.pdf?src-supplier=Avnet; ComponentLink1Description: https://datasheet.ciiva.com/8896/pyu-rc0402-51-rohs-l-6-8896149.pdf?src-supplier=Avnet; ComponentLink2URL: https://datasheet.ciiva.com/16790/pyu-rc0402-51-rohs-l-6-r-16790444.pdf?src-supplier=Future+Electronics; ComponentLink2Description: https://datasheet.ciiva.com/16790/pyu-rc0402-51-rohs-l-6-r-16790444.pdf?src-supplier=Future+Electronics; Supplier Part Number 1: 603-RC0402FR-070RL; LCSC Part Number: C106231
SW5 = B3U-1000P: SWITCH TACTILE SPST-NO 0.05A 12V; Manufacturer: Omron; Mechanical Life: 200000Cycles; Operating Force: 1.5N; Throw Configuration: SPST; Current Rating: 50mA; Contact Resistance: 100mR; Illumination Type: Non-Illuminated,Illuminated; Switch Travel: 0.15mm; Switch Function: Off-Mom; Actuator Type: Standard; Actuator Length: 0.4mm; Ratings: Dust Proof,IP40; ComponentLink1URL: http://www.farnell.com/datasheets/60838.pdf?src-supplier=Farnell; ComponentLink1Description: http://www.farnell.com/datasheets/60838.pdf?src-supplier=Farnell; ComponentLink2URL: http://www.farnell.com/datasheets/60838.pdf?src-supplier=Element14; ComponentLink2Description: http://www.farnell.com/datasheets/60838.pdf?src-supplier=Element14; ComponentLink3URL: https://omronfs.omron.com/en_US/ecb/products/pdf/en-b3u.pdf?src-supplier=Digi-Key; ComponentLink3Description: https://omronfs.omron.com/en_US/ecb/products/pdf/en-b3u.pdf?src-supplier=Digi-Key; ComponentLink4URL: http://www.omron.com/ecb/products/pdf/en-b3u.pdf?src-supplier=Digi-Key; ComponentLink4Description: http://www.omron.com/ecb/products/pdf/en-b3u.pdf?src-supplier=Digi-Key; ComponentLink5URL: https://www.distrelec.biz/Web/Downloads/he/et/B3U_eng_datasheet.pdf?mime=application%2Fpdf&src-supplier=Distrelec; ComponentLink5Description: https://www.distrelec.biz/Web/Downloads/he/et/B3U_eng_datasheet.pdf?mime=application%2Fpdf&src-supplier=Distrelec; ComponentLink6URL: http://www.onlinecomponents.com/productFiles/mf-OM/en-b3u.pdf?src-supplier=Onlinecomponents.com; ComponentLink6Description: http://www.onlinecomponents.com/productFiles/mf-OM/en-b3u.pdf?src-supplier=Onlinecomponents.com; Supplier 1: Digi-Key; Manufacturer Part Number: B3U-1000P; Stock 1: 116454; Pricing 1: 1=1, 10=0.961, 25=0.9064, 50=0.7976, 100=0.7251, 250=0.68888, 500=0.67074, 1000=0.52571 (USD); Mount: Surface Mount; Weight: 0.000776oz; Contact Material: Silver; Min Operating Temperature: -25°C; Max Operating Temperature: 70°C; Packaging: Tape and Reel; Voltage Rating (DC): 12V; Package Quantity: 1; Max Current Rating: 50mA; Termination: SMD/SMT; Orientation: Straight; Max Voltage Rating (DC): 12V; Electrical Life: 200000Cycles; Insulation Resistance: 100MR; Contact Current Rating: 50mA; Length: 4mm; Height: 1.2mm; Depth: 2.5mm; Width: 3mm; REACH SVHC: Unknown; Lead Free: Lead Free; ComponentLink7URL: https://www.verical.com/server-webapp/html/getDatasheet?partID=552554&src-supplier=Verical; ComponentLink7Description: https://www.verical.com/server-webapp/html/getDatasheet?partID=552554&src-supplier=Verical; ComponentLink8URL: http://www.farnell.com/datasheets/1685550.pdf?src-supplier=Element14; ComponentLink8Description: http://www.farnell.com/datasheets/1685550.pdf?src-supplier=Element14; ComponentLink9URL: http://www.farnell.com/datasheets/2610940.pdf?src-supplier=Farnell; ComponentLink9Description: http://www.farnell.com/datasheets/2610940.pdf?src-supplier=Farnell; ComponentLink10URL: https://www.alliedelec.com/m/d/4c8a9ef82804fc3c241a13c1e298fd73.pdf?src-supplier=Allied+Electronics; ComponentLink10Description: https://www.alliedelec.com/m/d/4c8a9ef82804fc3c241a13c1e298fd73.pdf?src-supplier=Allied+Electronics; Supplier Part Number 1: SW1020DKR-ND; LCSC Part Number: C231329; Item Type: Switch
TP9 TP10 = TEST POINT 0.5mm Dia: Test Point ON; Item Type: Test Point; Manufacturer Part Number: TEST POINT 0.5mm Dia
U15 = STM32F446VET6: IC MCU 32BIT 512KB FLASH 100LQFP; Manufacturer: STMicroelectronics; Manufacturer Part Number: STM32F446VET6; Package: LQFP (14x14); LCSC Part Number: C91929; Item Type: IC
X5 = 5TJ480000XYLBC: 8MHz 18pF ±10ppm SMD5032-4P Crystals ROHS; Manufacturer: JYJE; Manufacturer Part Number: 5TJ480000XYLBC; ComponentLink1Description: LCSC; ComponentLink1URL: https://www.lcsc.com/product-detail/Crystals_JYJE-5TJ480000XYLBC_C2149247.html; Package: SMD5032-4P; LCSC Part Number: C2149247; Item Type: Crystal

## Sheet Motor_Driver_Sheet3.SchDoc
size 420 x 297 mm; SheetNumber: 19; SheetTotal: 26
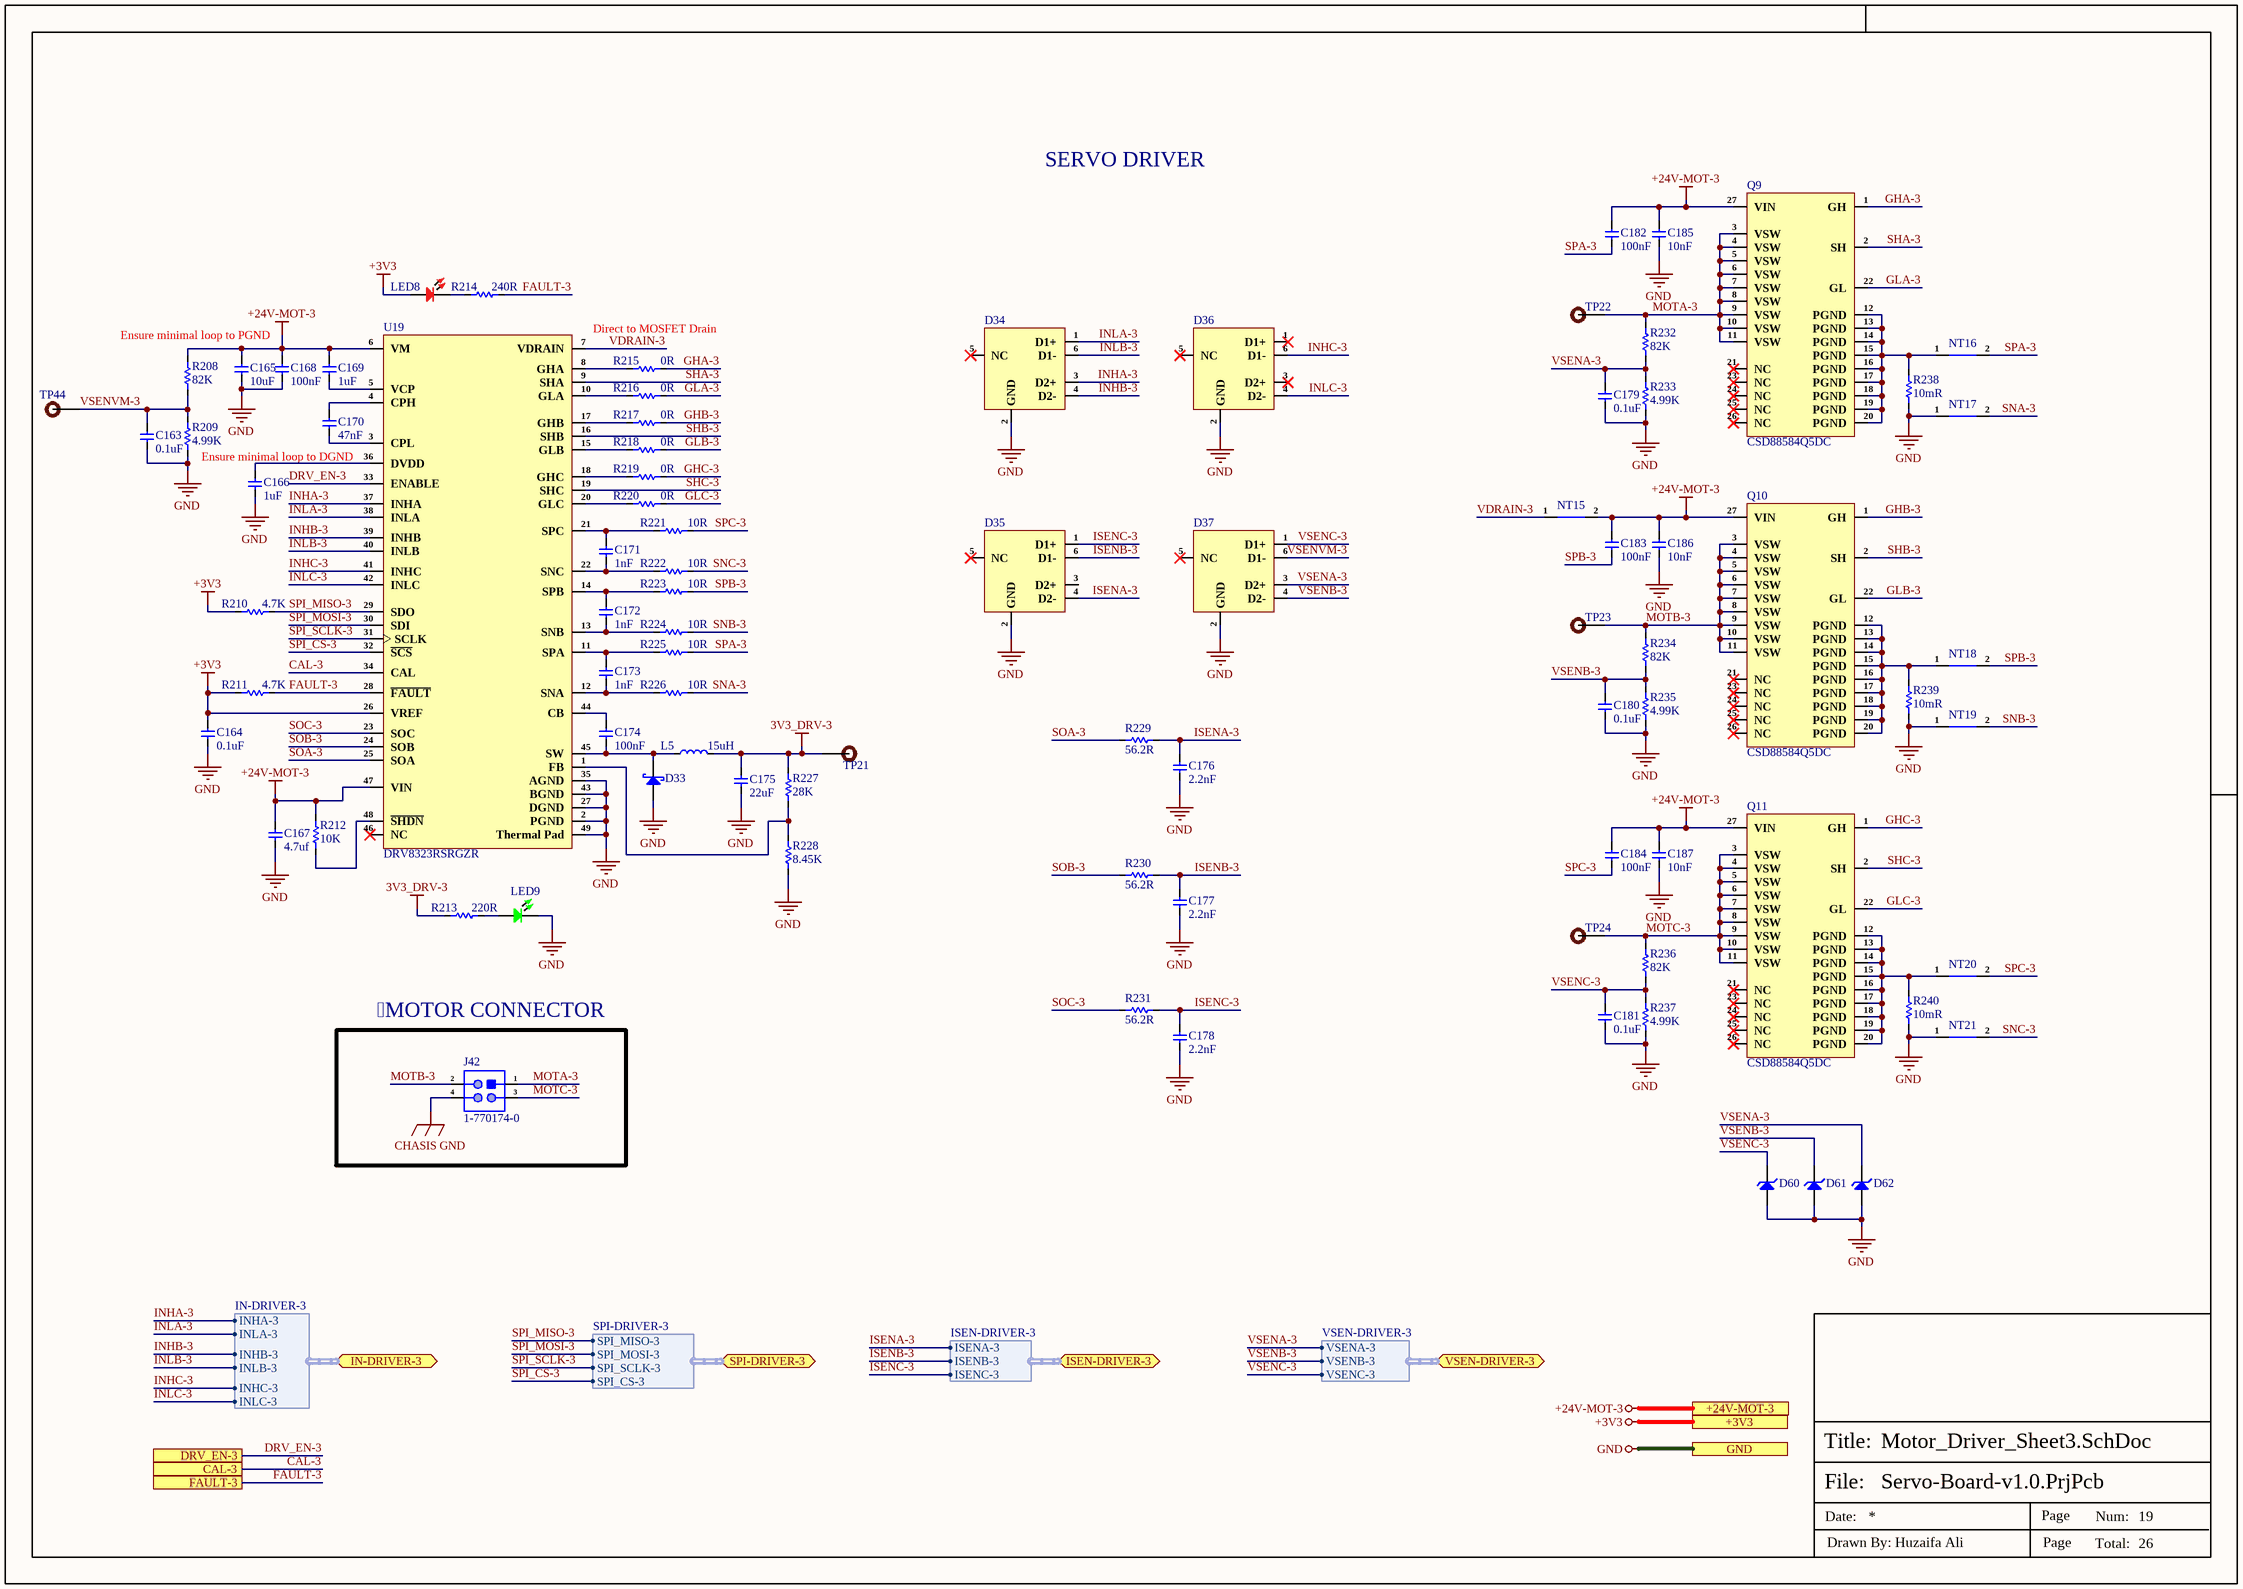
[diagram p7: Motor_Driver_Sheet3.SchDoc]

### Parts
C163  0.1uF  [Cap-0402]
C164  0.1uF  [Cap-0402]
C165  10uF  [Cap-1206]
C166  1uF  [Cap-0603]
C167  4.7uf  [Cap-0805]
C168  100nF  [Cap-0603]
C169  1uF  [Cap-0603]
C170  47nF  [Cap-0402]
C171  1nF  [Cap-0402]
C172  1nF  [Cap-0402]
C173  1nF  [Cap-0402]
C174  100nF  [Cap-0603]
C175  22uF  [Cap-0603]
C176  2.2nF  [Cap-0603]
C177  2.2nF  [Cap-0603]
C178  2.2nF  [Cap-0603]
C179  0.1uF  [Cap-0402]
C180  0.1uF  [Cap-0402]
C181  0.1uF  [Cap-0402]
C182  100nF  [Cap-0603]
C183  100nF  [Cap-0603]
C184  100nF  [Cap-0603]
C185  10nF  [Cap-0402]
C186  10nF  [Cap-0402]
C187  10nF  [Cap-0402]
D33  SS24A  [SMA]  (value not drawn)
D34  TPD4E1U06DCKR  [SOT-363]  (value not drawn)
D35  TPD4E1U06DCKR  [SOT-363]  (value not drawn)
D36  TPD4E1U06DCKR  [SOT-363]  (value not drawn)
D37  TPD4E1U06DCKR  [SOT-363]  (value not drawn)
D60  MM3Z3V3B  [SOD323F]  (value not drawn)
D61  MM3Z3V3B  [SOD323F]  (value not drawn)
D62  MM3Z3V3B  [SOD323F]  (value not drawn)
J42  1-770174-0  [1-770174-0]
L5  15uH  [FEXL0550A-150M]
LED8  RED  [LED-0603]  (value not drawn)
LED9  Emerald  [LED-0603]  (value not drawn)
NT15  Net Tie_SMD  [Net Tie Pad]  (value not drawn)  (net tie, no BOM)
NT16  Net Tie_SMD  [Net Tie Pad]  (value not drawn)  (net tie, no BOM)
NT17  Net Tie_SMD  [Net Tie Pad]  (value not drawn)  (net tie, no BOM)
NT18  Net Tie_SMD  [Net Tie Pad]  (value not drawn)  (net tie, no BOM)
NT19  Net Tie_SMD  [Net Tie Pad]  (value not drawn)  (net tie, no BOM)
NT20  Net Tie_SMD  [Net Tie Pad]  (value not drawn)  (net tie, no BOM)
NT21  Net Tie_SMD  [Net Tie Pad]  (value not drawn)  (net tie, no BOM)
Q9  CSD88584Q5DC  [22-VSON-CLIP (5x6)]
Q10  CSD88584Q5DC  [22-VSON-CLIP (5x6)]
Q11  CSD88584Q5DC  [22-VSON-CLIP (5x6)]
R208  82K  [Res-0603]
R209  4.99K  [Res-0603]
R210  4.7K  [Res-0402]
R211  4.7K  [Res-0402]
R212  10K  [Res-0402]
R213  220R  [Res-0603]
R214  240R  [Res-0402]
R215  0R  [Res-0402]
R216  0R  [Res-0402]
R217  0R  [Res-0402]
R218  0R  [Res-0402]
R219  0R  [Res-0402]
R220  0R  [Res-0402]
R221  10R  [Res-0603]
R222  10R  [Res-0603]
R223  10R  [Res-0603]
R224  10R  [Res-0603]
R225  10R  [Res-0603]
R226  10R  [Res-0603]
R227  28K  [Res-0402]
R228  8.45K  [Res-0402]
R229  56.2R  [Res-0603]
R230  56.2R  [Res-0603]
R231  56.2R  [Res-0603]
R232  82K  [Res-0603]
R233  4.99K  [Res-0603]
R234  82K  [Res-0603]
R235  4.99K  [Res-0603]
R236  82K  [Res-0603]
R237  4.99K  [Res-0603]
R238  10mR  [RES-2512]
R239  10mR  [RES-2512]
R240  10mR  [RES-2512]
TP21  TEST POINT 0.5mm Dia  [Test-point - 0.5mm]  (value not drawn)  (no BOM)
TP22  TEST POINT 0.5mm Dia  [Test-point - 0.5mm]  (value not drawn)  (no BOM)
TP23  TEST POINT 0.5mm Dia  [Test-point - 0.5mm]  (value not drawn)  (no BOM)
TP24  TEST POINT 0.5mm Dia  [Test-point - 0.5mm]  (value not drawn)  (no BOM)
TP44  TEST POINT 0.5mm Dia  [Test-point - 0.5mm]  (value not drawn)  (no BOM)
U19  DRV8323RSRGZR  [48-VQFN (7x7)]

### Ports
+3V3 (see Servo3[2A], CAN_Sheet[4D], Controller_Sheet[5D], DIO_1[5D], DIO_2[5D], DIO_3[5D], DIO_4[5D], Encoder_Sheet1[5D], Encoder_Sheet2[4D], Encoder_Sheet3[4D], Encoder_Sheet4[5D], EtherCAT_Sheet[5D], Motor_Driver_Sheet1[5D], Motor_Driver_Sheet2[5D], Motor_Driver_Sheet4[5D], Power_Sheet[5D], RS485_RS232_Sheet[5D], Sec_Controller_Sheet1[5D], Sec_Controller_Sheet2[5D], Sec_Controller_Sheet3[5D], Sec_Controller_Sheet4[5D], Servo1[5D], Servo2[5D], Servo3[5D], Servo4[5D]), +24V-MOT-3 (see Servo3[2A], Power_Sheet[5D], Servo3[5D]), CAL-3 (see Servo3[2B], Sec_Controller_Sheet3[2D]), DRV_EN-3 (see Servo3[2B], Sec_Controller_Sheet3[2D]), FAULT-3 (see Servo3[2B], Sec_Controller_Sheet3[2D]), GND (see Servo3[2B], CAN_Sheet[4D], Controller_Sheet[5D], DIO_1[5D], DIO_2[5D], DIO_3[5D], DIO_4[5D], Encoder_Sheet1[5D], Encoder_Sheet2[4D], Encoder_Sheet3[4D], Encoder_Sheet4[5D], EtherCAT_Sheet[5D], Motor_Driver_Sheet1[5D], Motor_Driver_Sheet2[5D], Motor_Driver_Sheet4[5D], Power_Sheet[5D], RS485_RS232_Sheet[5D], Sec_Controller_Sheet1[5D], Sec_Controller_Sheet2[5D], Sec_Controller_Sheet3[5D], Sec_Controller_Sheet4[5D], Servo1[5D], Servo2[5D], Servo3[5D], Servo4[5D]), IN-DRIVER-3 (bidir, harness IN-DRIVER-3, see Servo3[2B], Sec_Controller_Sheet3[2C]), ISEN-DRIVER-3 (bidir, harness ISEN-DRIVER-3, see Servo3[2B], Sec_Controller_Sheet3[2D]), SPI-DRIVER-3 (bidir, harness SPI-DRIVER-3, see Servo3[2B], Sec_Controller_Sheet3[2D]), VSEN-DRIVER-3 (bidir, harness VSEN-DRIVER-3, see Servo3[2B], Sec_Controller_Sheet3[3C])

### Harnesses
IN-DRIVER-3: INHA-3, INLA-3, INHB-3, INLB-3, INHC-3, INLC-3
SPI-DRIVER-3: SPI_MISO-3, SPI_MOSI-3, SPI_SCLK-3, SPI_CS-3
ISEN-DRIVER-3: ISENA-3, ISENB-3, ISENC-3
VSEN-DRIVER-3: VSENA-3, VSENB-3, VSENC-3

### Nets
3V3_DRV-3: C175.2 L5.2 R213.1 R227.2 TP21.1
+3V3: C164.2 LED8.1 R210.1 R211.1 U19.26(VREF) ; port +3V3
+24V-MOT-3: C165.2 C167.2 C168.2 C169.2 C182.2 C183.2 C184.2 C185.2 C186.2 C187.2 NT15.2 Q9.27(VIN) Q10.27(VIN) Q11.27(VIN) R208.2 R212.1 U19.6(VM) U19.47(VIN) ; port +24V-MOT-3
CHASIS GND: J42.4
GND: C163.1 C164.1 C165.1 C166.1 C167.1 C168.1 C175.1 C176.1 C177.1 C178.1 C179.1 C180.1 C181.1 C185.1 C186.1 C187.1 D33.2(A) D34.2(GND) D35.2(GND) D36.2(GND) D37.2(GND) D60.1(A) D61.1(A) D62.1(A) LED9.2 NT17.1 NT19.1 NT21.1 R209.1 R228.1 R233.1 R235.1 R237.1 R238.1 R239.1 R240.1 U19.2(PGND) U19.27(DGND) U19.35(AGND) U19.43(BGND) U19.49(Thermal_Pad) ; port GND
CAL-3: U19.34(CAL) ; port CAL-3
DRV_EN-3: U19.33(ENABLE) ; port DRV_EN-3
FAULT-3: R211.2 R214.2 U19.28(~{FAULT}) ; port FAULT-3
GHA-3: Q9.1(GH) R215.2
GHB-3: Q10.1(GH) R217.2
GHC-3: Q11.1(GH) R219.2
GLA-3: Q9.22(GL) R216.2
GLB-3: Q10.22(GL) R218.2
GLC-3: Q11.22(GL) R220.2
INHA-3: D34.3(D2+) U19.37(INHA) ; port IN-DRIVER-3.INHA-3
INHB-3: D34.4(D2-) U19.39(INHB) ; port IN-DRIVER-3.INHB-3
INHC-3: D36.6(D1-) U19.41(INHC) ; port IN-DRIVER-3.INHC-3
INLA-3: D34.1(D1+) U19.38(INLA) ; port IN-DRIVER-3.INLA-3
INLB-3: D34.6(D1-) U19.40(INLB) ; port IN-DRIVER-3.INLB-3
INLC-3: D36.4(D2-) U19.42(INLC) ; port IN-DRIVER-3.INLC-3
ISENA-3: C176.2 D35.4(D2-) R229.2 ; port ISEN-DRIVER-3.ISENA-3
ISENB-3: C177.2 D35.6(D1-) R230.2 ; port ISEN-DRIVER-3.ISENB-3
ISENC-3: C178.2 D35.1(D1+) R231.2 ; port ISEN-DRIVER-3.ISENC-3
MOTA-3: J42.1 Q9.3(VSW) Q9.4(VSW) Q9.5(VSW) Q9.6(VSW) Q9.7(VSW) Q9.8(VSW) Q9.9(VSW) Q9.10(VSW) Q9.11(VSW) R232.2 TP22.1
MOTB-3: J42.2 Q10.3(VSW) Q10.4(VSW) Q10.5(VSW) Q10.6(VSW) Q10.7(VSW) Q10.8(VSW) Q10.9(VSW) Q10.10(VSW) Q10.11(VSW) R234.2 TP23.1
MOTC-3: J42.3 Q11.3(VSW) Q11.4(VSW) Q11.5(VSW) Q11.6(VSW) Q11.7(VSW) Q11.8(VSW) Q11.9(VSW) Q11.10(VSW) Q11.11(VSW) R236.2 TP24.1
SHA-3: Q9.2(SH) U19.9(SHA)
SHB-3: Q10.2(SH) U19.16(SHB)
SHC-3: Q11.2(SH) U19.19(SHC)
SNA-3: NT17.2 R226.2
SNB-3: NT19.2 R224.2
SNC-3: NT21.2 R222.2
SOA-3: R229.1 U19.25(SOA)
SOB-3: R230.1 U19.24(SOB)
SOC-3: R231.1 U19.23(SOC)
SPA-3: C182.1 NT16.2 R225.2
SPB-3: C183.1 NT18.2 R223.2
SPC-3: C184.1 NT20.2 R221.2
SPI_CS-3: U19.32(~{SCS}) ; port SPI-DRIVER-3.SPI_CS-3
SPI_MISO-3: R210.2 U19.29(SDO) ; port SPI-DRIVER-3.SPI_MISO-3
SPI_MOSI-3: U19.30(SDI) ; port SPI-DRIVER-3.SPI_MOSI-3
SPI_SCLK-3: U19.31(SCLK) ; port SPI-DRIVER-3.SPI_SCLK-3
VDRAIN-3: NT15.1 U19.7(VDRAIN)
VSENA-3: C179.2 D37.3(D2+) D62.2(K) R232.1 R233.2 ; port VSEN-DRIVER-3.VSENA-3
VSENB-3: C180.2 D37.4(D2-) D61.2(K) R234.1 R235.2 ; port VSEN-DRIVER-3.VSENB-3
VSENC-3: C181.2 D37.1(D1+) D60.2(K) R236.1 R237.2 ; port VSEN-DRIVER-3.VSENC-3
VSENVM-3: C163.2 D37.6(D1-) R208.1 R209.2 TP44.1
NetC166_2: C166.2 U19.36(DVDD)
NetC169_1: C169.1 U19.5(VCP)
NetC170_1: C170.1 U19.3(CPL)
NetC170_2: C170.2 U19.4(CPH)
NetC171_1: C171.1 R222.1 U19.22(SNC)
NetC171_2: C171.2 R221.1 U19.21(SPC)
NetC172_1: C172.1 R224.1 U19.13(SNB)
NetC172_2: C172.2 R223.1 U19.14(SPB)
NetC173_1: C173.1 R226.1 U19.12(SNA)
NetC173_2: C173.2 R225.1 U19.11(SPA)
NetC174_1: C174.1 D33.1(K) L5.1 U19.45(SW)
NetC174_2: C174.2 U19.44(CB)
NetLED8_2: LED8.2 R214.1
NetLED9_1: LED9.1 R213.2
NetNT16_1: NT16.1 Q9.12(PGND) Q9.13(PGND) Q9.14(PGND) Q9.15(PGND) Q9.16(PGND) Q9.17(PGND) Q9.18(PGND) Q9.19(PGND) Q9.20(PGND) R238.2
NetNT18_1: NT18.1 Q10.12(PGND) Q10.13(PGND) Q10.14(PGND) Q10.15(PGND) Q10.16(PGND) Q10.17(PGND) Q10.18(PGND) Q10.19(PGND) Q10.20(PGND) R239.2
NetNT20_1: NT20.1 Q11.12(PGND) Q11.13(PGND) Q11.14(PGND) Q11.15(PGND) Q11.16(PGND) Q11.17(PGND) Q11.18(PGND) Q11.19(PGND) Q11.20(PGND) R240.2
NetR212_2: R212.2 U19.48(~{SHDN})
NetR215_1: R215.1 U19.8(GHA)
NetR216_1: R216.1 U19.10(GLA)
NetR217_1: R217.1 U19.17(GHB)
NetR218_1: R218.1 U19.15(GLB)
NetR219_1: R219.1 U19.18(GHC)
NetR220_1: R220.1 U19.20(GLC)
NetR227_1: R227.1 R228.2 U19.1(FB)

Not connected (* = marked no-connect by the designer): D34 5(NC)*; D35 3(D2+) 5(NC)*; D36 1(D1+)* 3(D2+)* 5(NC)*; D37 5(NC)*; Q9 21(NC)* 23(NC)* 24(NC)* 25(NC)* 26(NC)*; Q10 21(NC)* 23(NC)* 24(NC)* 25(NC)* 26(NC)*; Q11 21(NC)* 23(NC)* 24(NC)* 25(NC)* 26(NC)*; U19 46(NC)*

### Notes on the sheet
- SERVO DRIVER
- Direct to MOSFET Drain
- Ensure minimal loop to PGND
- Ensure minimal loop to DGND
- MOTOR CONNECTOR
- File:
- Title:
- Date:
- Page
- Num:
- Total:
- Drawn By: Huzaifa Ali